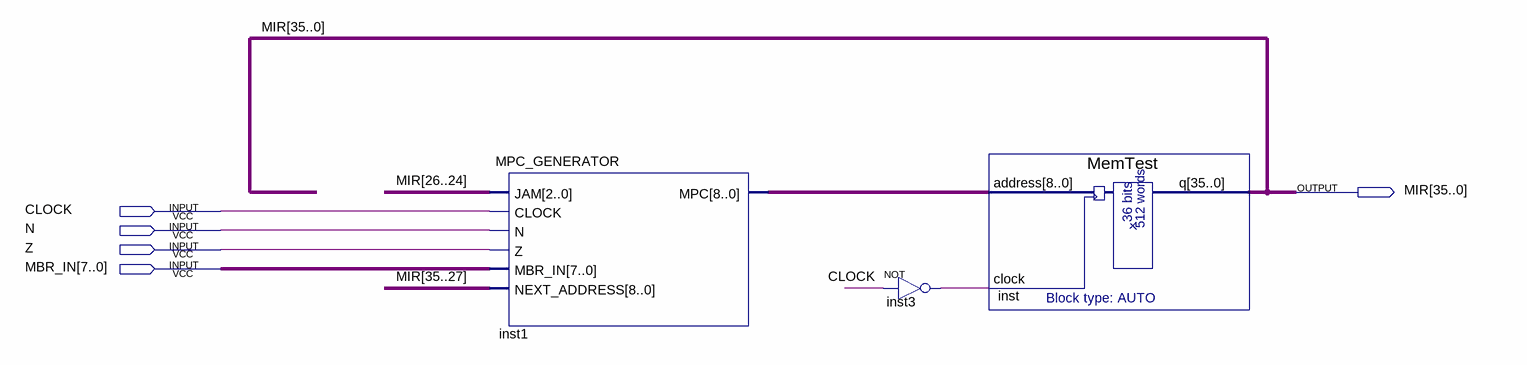
[diagram p0: schematic sheet]
// Quartus schematic MICROPROGRAM.bdf as structural Verilog: 3 symbols, 5 pins
module MICROPROGRAM (
  input  CLOCK,
  input  N,
  input  Z,
  input  [7:0] MBR_IN,
  output [35:0] MIR
);

  wire inst3_out;
  wire [8:0] inst1_mpc;

  MPC_GENERATOR inst1 (
    .JAM(MIR[26:24]), .CLOCK(CLOCK), .N(N), .Z(Z), .MBR_IN(MBR_IN), .NEXT_ADDRESS(MIR[35:27]), .MPC(inst1_mpc));
  not inst3 (inst3_out, CLOCK);
  MemTest inst (.address(inst1_mpc), .clock(inst3_out), .q(MIR));
endmodule
